# Altium project BIOS Deck Lite.PrjPcb
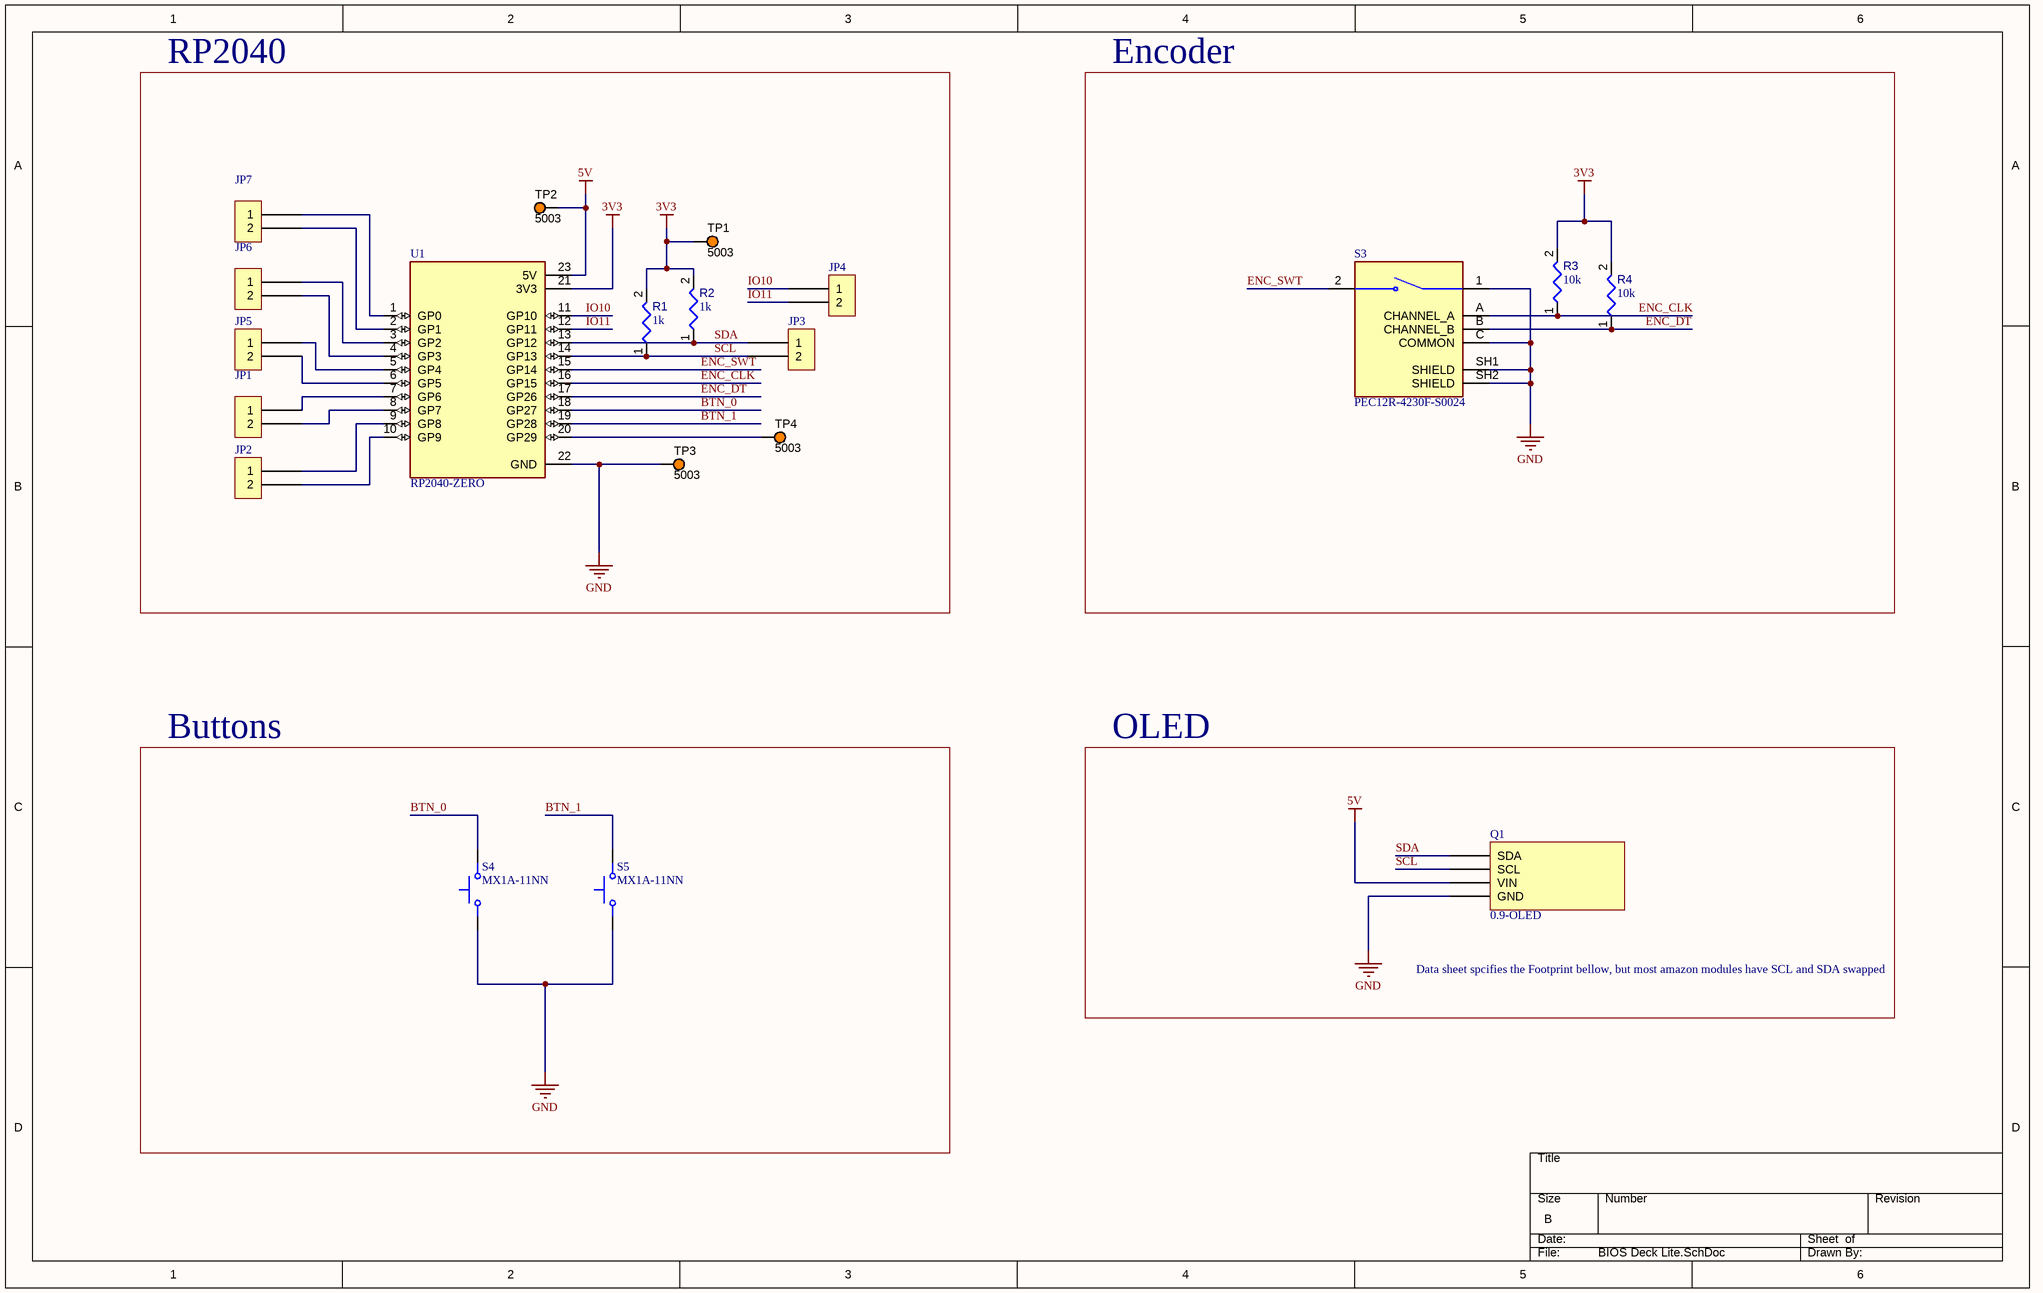
[diagram p0: BIOS Deck Lite.SchDoc]
CAGE_CODE: ?????; CONTRACT_NUMBER: <CONTRACT NO>; DOC_NO_ASSY_DWG: <ASSY DWG NO>; DOC_NO_BOM: <BOM DOC NO>; DOC_NO_FAB_DWG: <FAB DWG NO>; DOC_NO_SCH_DWG: <SCH DWG NO>; PCB_2_DEC_TOL: +/-.01; PCB_3_DEC_TOL: +/-.010; PCB_ANG_TOL: +/-1/2; PCB_ASSEMBLY_NO: <PCB ASSY NO>; PCB_CHECKER: - -----; PCB_CHECKER_APP_DATE: --/--/----; PCB_DESIGNER: - -----; PCB_DESIGNER_APP_DATE: --/--/----; PCB_DWG_NO: <PCB DWG NO>; PCB_ENGINEER: - -----; PCB_ENGINEER_APP_DATE: --/--/----; PCB_PART_NUMBER: <PCB PN>; PCB_REV: A; SCH_REV: A
1 sheet, 20 parts. Net scope: global (net labels, ports and power ports of the same name join across sheets).
Board file: BIOS Deck Lite.PcbDoc

## Sheet BIOS Deck Lite.SchDoc
size B; SheetNumber: 1; SheetTotal: 1; ENG_APP_DATE: --/--/--; DSN_APP_DATE: --/--/--; CHK_APP_DATE: --/--/--

### Parts
JP1  Header 2  [Header 2-Footprint-1]  (value not drawn)
JP2  Header 2  [Header 2-Footprint-1]  (value not drawn)
JP3  Header 2  [Header 2-Footprint-1]  (value not drawn)
JP4  Header 2  [Header 2-Footprint-1]  (value not drawn)
JP5  Header 2  [Header 2-Footprint-1]  (value not drawn)
JP6  Header 2  [Header 2-Footprint-1]  (value not drawn)
JP7  Header 2  [Header 2-Footprint-1]  (value not drawn)
Q1  0.9-OLED  [New footprint 2]
R1  value 1k  [RESC1608X55X25ML10T15]  (hidden comment: Resistor 10k +/-1% 0603 100 mW)
R2  value 1k  [RESC1608X55X25ML10T15]  (hidden comment: Resistor 10k +/-1% 0603 100 mW)
R3  value 10k  [RESC1608X55X25ML10T15]  (hidden comment: Resistor 10k +/-1% 0603 100 mW)
R4  value 10k  [RESC1608X55X25ML10T15]  (hidden comment: Resistor 10k +/-1% 0603 100 mW)
S3  PEC12R-4230F-S0024  [XDCR_PEC12R-4230F-S0024]
S4  MX1A-11NN  [SW_MX1A-11NN]
S5  MX1A-11NN  [SW_MX1A-11NN]
TP1  5003  [KSTN-5003]
TP2  5003  [KSTN-5003]
TP3  5003  [KSTN-5003]
TP4  5003  [KSTN-5003]
U1  RP2040-ZERO  [MODULE_RP2040-ZERO]

### Blocks framed on the sheet
RP2040: JP1-JP7 R1 R2 TP1-TP4 U1
Encoder: R3 R4 S3
Buttons: S4 S5
OLED: Q1

### Nets
3V3: R1.2 R2.2 R3.2 R4.2 TP1.1 U1.21(3V3)
5V: Q1.3(VIN) TP2.1 U1.23(5V)
GND: Q1.4(GND) S3.1 S3.C(COMMON) S3.SH1(SHIELD) S3.SH2(SHIELD) S4.1 S5.1 TP3.1 U1.22(GND)
BTN_0: S4.2 U1.18(GP27)
BTN_1: S5.2 U1.19(GP28)
ENC_CLK: R3.1 S3.A(CHANNEL_A) U1.16(GP15)
ENC_DT: R4.1 S3.B(CHANNEL_B) U1.17(GP26)
ENC_SWT: S3.2 U1.15(GP14)
IO10: JP4.1 U1.11(GP10)
IO11: JP4.2 U1.12(GP11)
SCL: JP3.2 Q1.2(SCL) R1.1 U1.14(GP13)
SDA: JP3.1 Q1.1(SDA) R2.1 U1.13(GP12)
NetJP1_1: JP1.1 U1.7(GP6)
NetJP1_2: JP1.2 U1.8(GP7)
NetJP2_1: JP2.1 U1.9(GP8)
NetJP2_2: JP2.2 U1.10(GP9)
NetJP5_1: JP5.1 U1.5(GP4)
NetJP5_2: JP5.2 U1.6(GP5)
NetJP6_1: JP6.1 U1.3(GP2)
NetJP6_2: JP6.2 U1.4(GP3)
NetJP7_1: JP7.1 U1.1(GP0)
NetJP7_2: JP7.2 U1.2(GP1)
NetTP4_1: TP4.1 U1.20(GP29)

### Notes on the sheet
- Data sheet spcifies the Footprint bellow, but most amazon modules have SCL and SDA swapped
- DWG. NO.
- REV.
- SHT.
- THIS DOCUMENT AND THE DATA DISCLOSED HEREIN OR HEREWITH IS THE PROPERTY OF ALTIUM LIMITED AND MAY BE FREELY DISTRIBUTED IN WHOLE. NO RIGHTS ARE RESERVED OR EXPRESS OR IMPLIED WARANTEE GIVEN.
- REVISION
- DESCRIPTION
- DATE
- APPROVED
- ENG:
- APPROVALS
- PROJECT
- DSN:
- CHK:
- REFERENCE DOCUMENTS
- PROJECT REVISION:
- TITLE
- DOCUMENT REVISION:
- DESIGN ITEM:
- BOM:
- FAB DWG:
- PCB DWG:
- ASSY DWG:
- SCALE:
- SIZE
- B
- CAGE CODE
- FILE NAME
- DWG NO.
- SHEET
- OF
- REV

### Library data of the parts
JP1-JP7 = CMP-002-00072-6: Header Pin 2x1
Q1 = CMP-00002-1: 0.9" OLED
R1-R4 = CMP-009-00017-5: Chip Resistor, 10 KOhm, +/- 1%, 01 W, -55 to 155 degC, 0603 (1608 Metric); Voltage Rating: 50V; Power: 100mW; RoHS Compliant: True; Min Operating Temperature: -55°C; Pins: 2; Case/Package: 0603; Mounting Technology: SM; Max Operating Temperature: 155°C; Tolerance: 1%
S3 = PEC12R-4230F-S0024-000002-1: 24 Pulse Incremental Mechanical Rotary Encoder w/ 6 mm Flat Shaft,Through Hole; MF: Bourns; Package: None; Check_prices: https://www.snapeda.com/parts/PEC12R-4230F-S0024/Bourns/view-part/?ref=eda; Pin Count: 7; MP: PEC12R-4230F-S0024; Component Type: Standard; Value: *; Source: PEC12R-4230F-S0024.SchLib; Design Item ID: PEC12R-4230F-S0024; SnapEDA_Link: https://www.snapeda.com/parts/PEC12R-4230F-S0024/Bourns/view-part/?ref=snap
S4 S5 = CMP-011-00014-1: Switch,Key,SPST-NO,Keyboard,Low Profile,10mA,12VDC,Face Place Mount,Std Force; MF: Cherry; Design Item ID: MX1A-11NN; Case/Package: None; SnapEDA_Link: https://www.snapeda.com/parts/MX1A-11NN/Cherry/view-part/?ref=snap; Value: *; MP: MX1A-11NN; Component Type: Standard; Pins: 2; Check_prices: https://www.snapeda.com/parts/MX1A-11NN/Cherry/view-part/?ref=eda; Source: MX1A-11NN.SchLib
TP1-TP4 = CMP-002-00037-2: Test Point, Orange, Height 4.6 mm, Tail Length 3 mm, 1-Pin THD, RoHS; Manufacturer: Keystone; Colour: Orange; Packaging: Bulk; Package Description: 1-Pin Through Hole Device, Dia 2.54 mm; Pins: 1; Package Reference: 5003; Datasheet Version: Jun-15; Case/Package: 5003; Mounting Technology: TH; Connector Type: TestPoint; Diameter: 2.54mm; Contact Material: Bronze; Datasheet URL: http://keyelco.com/userAssets/file/M65p56.pdf; Manufacturer URL: http://www.keyelco.com/; Package Quantity: 10; Contact Plating: Tin; RoHS Compliant: True
U1 = RP2040-ZERO: Low-Cost, High-Performance Pico-Like MCU Board Based On Raspberry Pi Microcontroller RP2040; MF: Waveshare Electronics; SnapEDA_Link: https://www.snapeda.com/parts/RP2040-ZERO/Waveshare+Electronics/view-part/?ref=snap; Package: Package; Value: *; MP: RP2040-ZERO; Check_prices: https://www.snapeda.com/parts/RP2040-ZERO/Waveshare+Electronics/view-part/?ref=eda